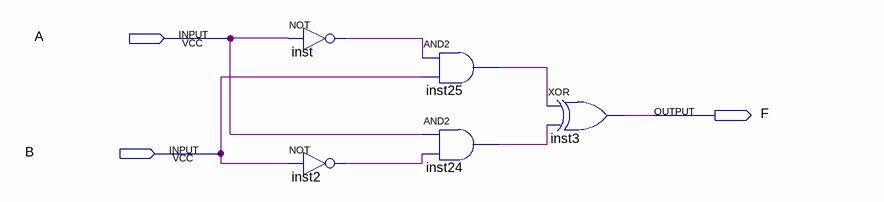
[diagram p0: schematic sheet]
// Quartus schematic ex1.bdf as structural Verilog: 5 symbols, 3 pins
module ex1 (
  input  A,
  input  B,
  output F
);

  wire inst2_out, inst24_out, inst25_out, inst_out;

  not inst (inst_out, A);
  not inst2 (inst2_out, B);
  and inst25 (inst25_out, inst_out, B);
  and inst24 (inst24_out, A, inst2_out);
  xor inst3 (F, inst25_out, inst24_out);
endmodule
